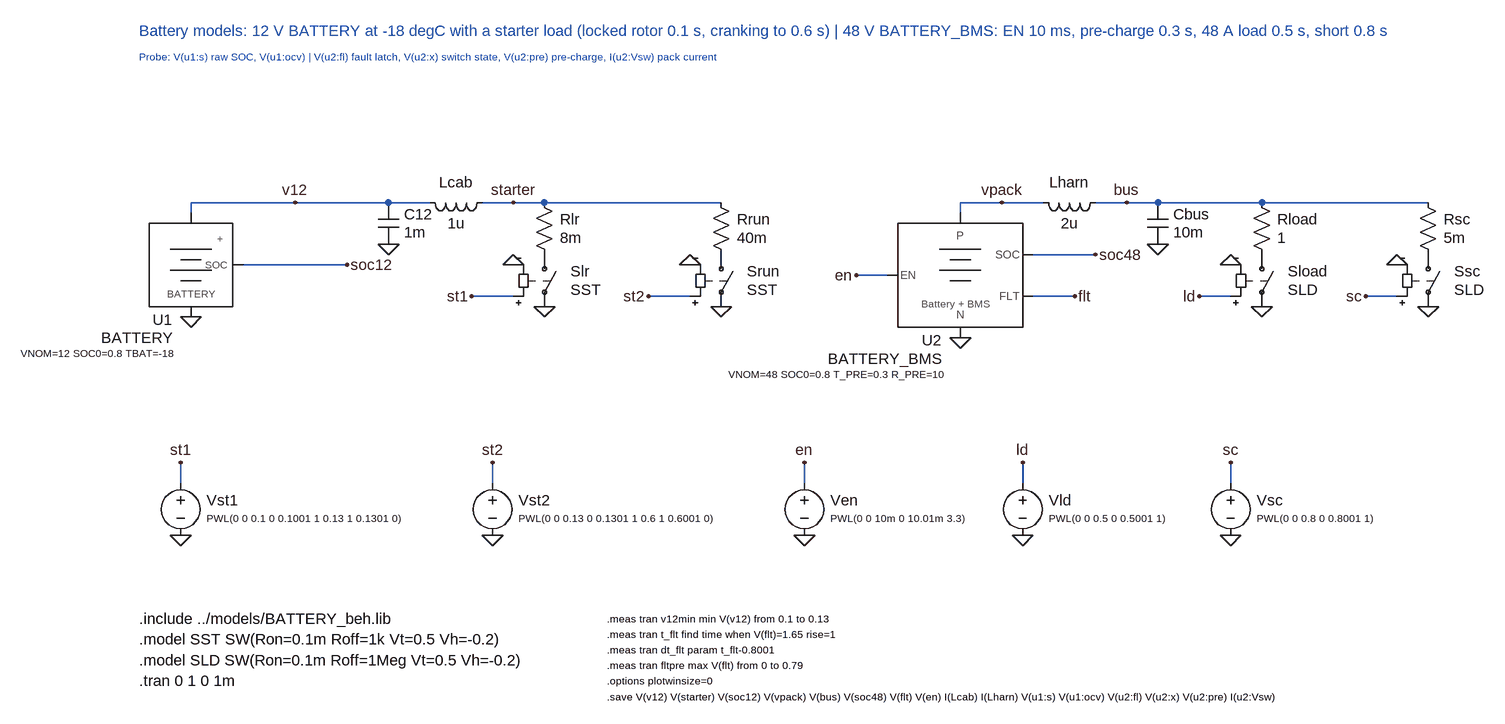
[diagram p0: schematic demo_battery.asc]
demo_battery.asc, the LTspice schematic file:
Version 4
SHEET 1 2200 1000
SYMBOL BATTERY 112 320 R0
SYMATTR InstName U1
SYMATTR SpiceLine VNOM=12 SOC0=0.8 TBAT=-18
FLAG 112 400 0
WIRE 192 320 352 320
FLAG 352 320 soc12
SYMBOL cap 400 224 R0
WINDOW 0 40 18 Left 2
WINDOW 3 40 46 Left 2
SYMATTR InstName C12
SYMATTR Value 1m
SYMATTR SpiceLine Rser=0.1
FLAG 416 288 0
SYMBOL ind 576 208 R90
WINDOW 0 0 56 VBottom 2
WINDOW 3 32 56 VTop 2
SYMATTR InstName Lcab
SYMATTR Value 1u
WIRE 112 240 112 224
WIRE 112 224 272 224
WIRE 272 224 416 224
FLAG 272 224 v12
WIRE 416 224 480 224
SYMBOL res 640 208 R0
WINDOW 0 40 42 Left 2
WINDOW 3 40 70 Left 2
SYMATTR InstName Rlr
SYMATTR Value 8m
WIRE 560 224 608 224
WIRE 608 224 656 224
FLAG 608 224 starter
SYMBOL sw 656 288 R0
WINDOW 0 40 42 Left 2
WINDOW 3 40 70 Left 2
SYMATTR InstName Slr
SYMATTR Value SST
FLAG 656 384 0
WIRE 608 368 544 368
FLAG 544 368 st1
FLAG 608 320 0
SYMBOL res 912 208 R0
WINDOW 0 40 42 Left 2
WINDOW 3 40 70 Left 2
SYMATTR InstName Rrun
SYMATTR Value 40m
WIRE 656 224 928 224
SYMBOL sw 928 288 R0
WINDOW 0 40 42 Left 2
WINDOW 3 40 70 Left 2
SYMATTR InstName Srun
SYMATTR Value SST
FLAG 928 384 0
WIRE 880 368 816 368
FLAG 816 368 st2
FLAG 880 320 0
SYMBOL BATTERY_BMS 1296 336 R0
SYMATTR InstName U2
SYMATTR SpiceLine VNOM=48 SOC0=0.8 T_PRE=0.3 R_PRE=10
FLAG 1296 432 0
WIRE 1408 304 1504 304
FLAG 1504 304 soc48
WIRE 1184 336 1136 336
FLAG 1136 336 en
WIRE 1408 368 1472 368
FLAG 1472 368 flt
SYMBOL ind 1520 208 R90
WINDOW 0 0 56 VBottom 2
WINDOW 3 32 56 VTop 2
SYMATTR InstName Lharn
SYMATTR Value 2u
WIRE 1296 240 1296 224
WIRE 1296 224 1360 224
WIRE 1360 224 1424 224
FLAG 1360 224 vpack
SYMBOL cap 1584 224 R0
WINDOW 0 40 18 Left 2
WINDOW 3 40 46 Left 2
SYMATTR InstName Cbus
SYMATTR Value 10m
SYMATTR SpiceLine Rser=5m
FLAG 1600 288 0
WIRE 1504 224 1552 224
WIRE 1552 224 1600 224
FLAG 1552 224 bus
SYMBOL res 1744 208 R0
WINDOW 0 40 42 Left 2
WINDOW 3 40 70 Left 2
SYMATTR InstName Rload
SYMATTR Value 1
WIRE 1600 224 1760 224
SYMBOL sw 1760 288 R0
WINDOW 0 40 42 Left 2
WINDOW 3 40 70 Left 2
SYMATTR InstName Sload
SYMATTR Value SLD
FLAG 1760 384 0
WIRE 1712 368 1664 368
FLAG 1664 368 ld
FLAG 1712 320 0
SYMBOL res 2000 208 R0
WINDOW 0 40 42 Left 2
WINDOW 3 40 70 Left 2
SYMATTR InstName Rsc
SYMATTR Value 5m
WIRE 1760 224 2016 224
SYMBOL sw 2016 288 R0
WINDOW 0 40 42 Left 2
WINDOW 3 40 70 Left 2
SYMATTR InstName Ssc
SYMATTR Value SLD
FLAG 2016 384 0
WIRE 1968 368 1920 368
FLAG 1920 368 sc
FLAG 1968 320 0
SYMBOL voltage 96 640 R0
WINDOW 0 40 42 Left 2
WINDOW 3 40 70 Left 1
SYMATTR InstName Vst1
SYMATTR Value PWL(0 0 0.1 0 0.1001 1 0.13 1 0.1301 0)
WIRE 96 656 96 624
FLAG 96 624 st1
FLAG 96 736 0
SYMBOL voltage 576 640 R0
WINDOW 0 40 42 Left 2
WINDOW 3 40 70 Left 1
SYMATTR InstName Vst2
SYMATTR Value PWL(0 0 0.13 0 0.1301 1 0.6 1 0.6001 0)
WIRE 576 656 576 624
FLAG 576 624 st2
FLAG 576 736 0
SYMBOL voltage 1056 640 R0
WINDOW 0 40 42 Left 2
WINDOW 3 40 70 Left 1
SYMATTR InstName Ven
SYMATTR Value PWL(0 0 10m 0 10.01m 3.3)
WIRE 1056 656 1056 624
FLAG 1056 624 en
FLAG 1056 736 0
SYMBOL voltage 1392 640 R0
WINDOW 0 40 42 Left 2
WINDOW 3 40 70 Left 1
SYMATTR InstName Vld
SYMATTR Value PWL(0 0 0.5 0 0.5001 1)
WIRE 1392 656 1392 624
FLAG 1392 624 ld
FLAG 1392 736 0
SYMBOL voltage 1712 640 R0
WINDOW 0 40 42 Left 2
WINDOW 3 40 70 Left 1
SYMATTR InstName Vsc
SYMATTR Value PWL(0 0 0.8 0 0.8001 1)
WIRE 1712 656 1712 624
FLAG 1712 624 sc
FLAG 1712 736 0
TEXT 32 -40 Left 2 ;Battery models: 12 V BATTERY at -18 degC with a starter load (locked rotor 0.1 s, cranking to 0.6 s) | 48 V BATTERY_BMS: EN 10 ms, pre-charge 0.3 s, 48 A load 0.5 s, short 0.8 s
TEXT 32 0 Left 1 ;Probe: V(u1:s) raw SOC, V(u1:ocv) | V(u2:fl) fault latch, V(u2:x) switch state, V(u2:pre) pre-charge, I(u2:Vsw) pack current
TEXT 32 864 Left 2 !.include ../models/BATTERY_beh.lib
TEXT 32 896 Left 2 !.model SST SW(Ron=0.1m Roff=1k Vt=0.5 Vh=-0.2)
TEXT 32 928 Left 2 !.model SLD SW(Ron=0.1m Roff=1Meg Vt=0.5 Vh=-0.2)
TEXT 32 960 Left 2 !.tran 0 1 0 1m
TEXT 752 864 Left 1 !.meas tran v12min min V(v12) from 0.1 to 0.13
TEXT 752 888 Left 1 !.meas tran t_flt find time when V(flt)=1.65 rise=1
TEXT 752 912 Left 1 !.meas tran dt_flt param t_flt-0.8001
TEXT 752 936 Left 1 !.meas tran fltpre max V(flt) from 0 to 0.79
TEXT 752 960 Left 1 !.options plotwinsize=0
TEXT 752 984 Left 1 !.save V(v12) V(starter) V(soc12) V(vpack) V(bus) V(soc48) V(flt) V(en) I(Lcab) I(Lharn) V(u1:s) V(u1:ocv) V(u2:fl) V(u2:x) V(u2:pre) I(u2:Vsw)

The netlist it stands for:
* demo_battery.asc
XU1 v12 0 soc12 BATTERY VNOM=12 SOC0=0.8 TBAT=-18  ; pins P N SOC
C12 v12 0 1m Rser=0.1
Lcab starter v12 1u
Rlr starter P001 8m
Slr P001 0 st1 0 SST
Rrun starter P002 40m
Srun P002 0 st2 0 SST
XU2 vpack 0 soc48 en flt BATTERY_BMS VNOM=48 SOC0=0.8 T_PRE=0.3 R_PRE=10  ; pins P N SOC EN FLT
Lharn bus vpack 2u
Cbus bus 0 10m Rser=5m
Rload bus P003 1
Sload P003 0 ld 0 SLD
Rsc bus P004 5m
Ssc P004 0 sc 0 SLD
Vst1 st1 0 PWL(0 0 0.1 0 0.1001 1 0.13 1 0.1301 0)
Vst2 st2 0 PWL(0 0 0.13 0 0.1301 1 0.6 1 0.6001 0)
Ven en 0 PWL(0 0 10m 0 10.01m 3.3)
Vld ld 0 PWL(0 0 0.5 0 0.5001 1)
Vsc sc 0 PWL(0 0 0.8 0 0.8001 1)
* Battery models: 12 V BATTERY at -18 degC with a starter load (locked rotor 0.1 s, cranking to 0.6 s) | 48 V BATTERY_BMS: EN 10 ms, pre-charge 0.3 s, 48 A load 0.5 s, short 0.8 s
* Probe: V(u1:s) raw SOC, V(u1:ocv) | V(u2:fl) fault latch, V(u2:x) switch state, V(u2:pre) pre-charge, I(u2:Vsw) pack current
.include ../models/BATTERY_beh.lib
.model SST SW(Ron=0.1m Roff=1k Vt=0.5 Vh=-0.2)
.model SLD SW(Ron=0.1m Roff=1Meg Vt=0.5 Vh=-0.2)
.tran 0 1 0 1m
.meas tran v12min min V(v12) from 0.1 to 0.13
.meas tran t_flt find time when V(flt)=1.65 rise=1
.meas tran dt_flt param t_flt-0.8001
.meas tran fltpre max V(flt) from 0 to 0.79
.options plotwinsize=0
.save V(v12) V(starter) V(soc12) V(vpack) V(bus) V(soc48) V(flt) V(en) I(Lcab) I(Lharn) V(u1:s) V(u1:ocv) V(u2:fl) V(u2:x) V(u2:pre) I(u2:Vsw)
.backanno
.end